# Altium schematic sheet Connector.SchDoc
size A4; SheetNumber: 5; SheetTotal: 5
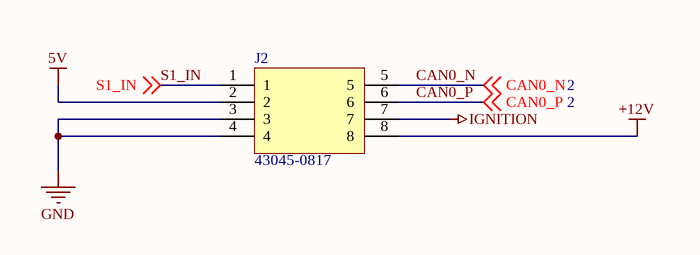
[diagram p0: Connector.SchDoc]

## Parts
J2  value 43045-0817  [MOLEX_430450817]  (hidden comment: MOLEX_43045-0817)

## Nets
5V: J2.2
+12V: J2.8
GND: J2.3 J2.4
IGNITION: J2.7
CAN0_N: J2.5 ; off-sheet CAN0_N
CAN0_P: J2.6 ; off-sheet CAN0_P
S1_IN: J2.1 ; off-sheet S1_IN

## Library data of the parts
J2 = MOLEX_43045-0817: Micro-Fit 3.0 Vertical Header, 3.00mm Pitch, Dual Row, 8 Circuits, with PCB Press-fit Metal Retention Clip, Glow-Wire Capable; Manufacturer: Molex; PartNumber: 43045-0817